# Altium schematic sheet Sheet1-BeforeClearParameters-20261026_114421_706.SchDoc
size A4; SheetNumber: 1; SheetTotal: 1
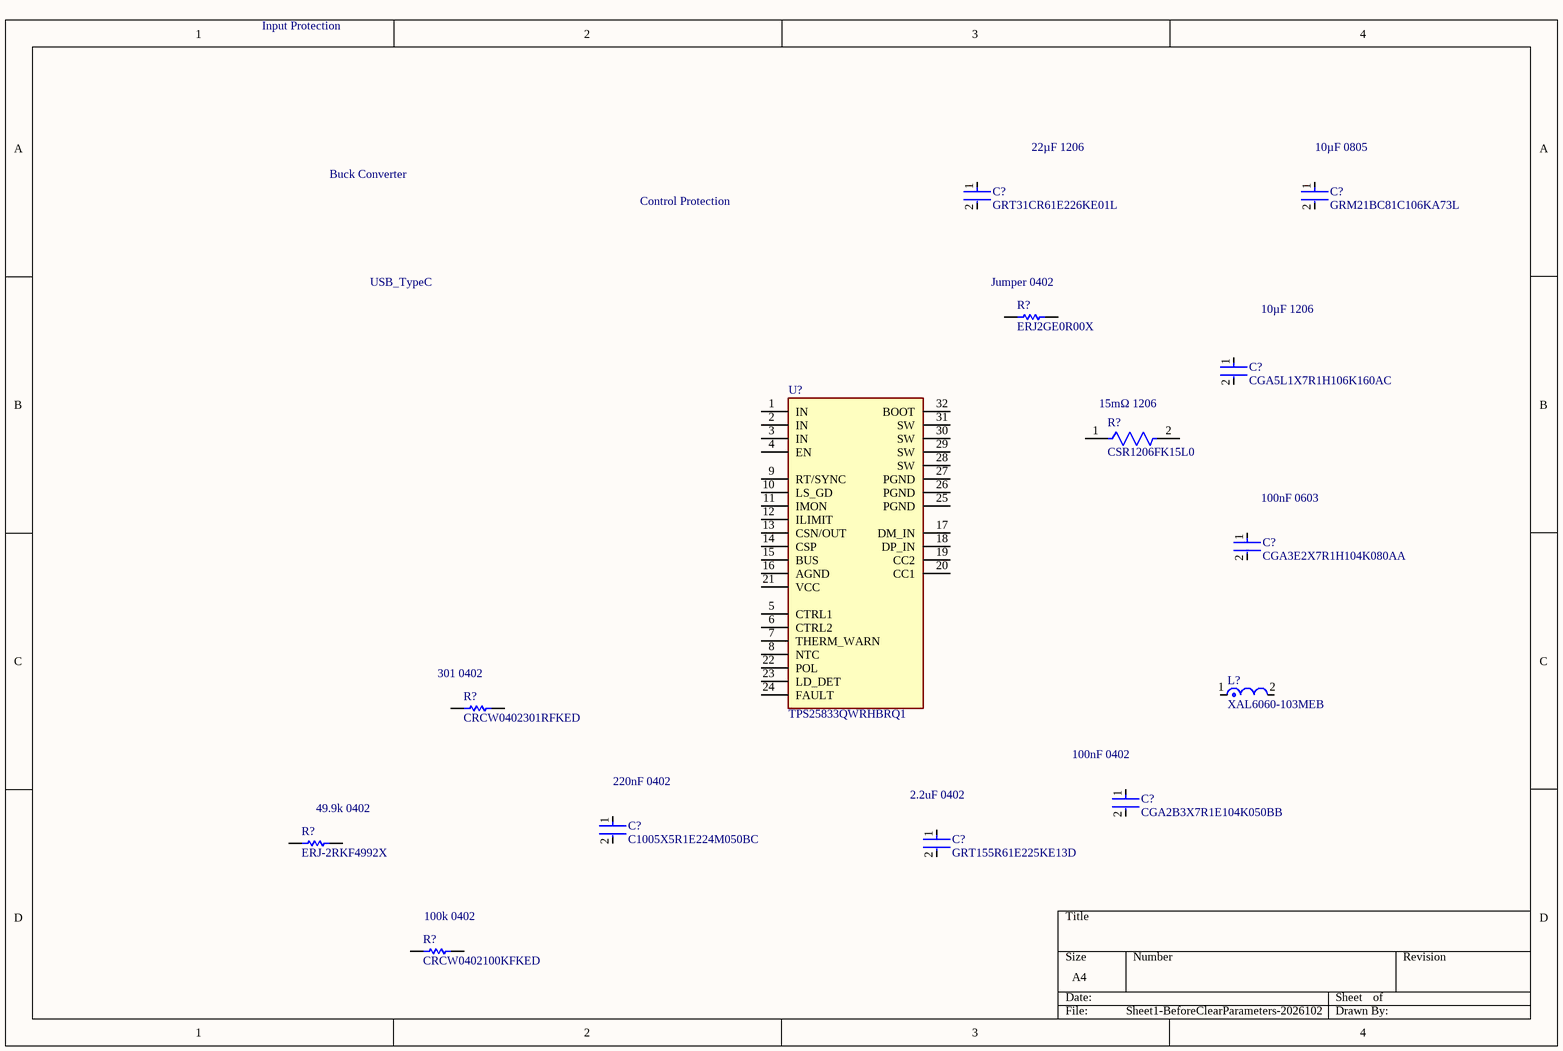
[diagram p0: Sheet1-BeforeClearParameters-20261026_114421_706.SchDoc]

## Parts
(Parts that share a designator on the sheet are numbered #1, #2 ... from top to bottom, then left to right.)
C?#1  GRT31CR61E226KE01L  [FP-CGA5L-0_3-0_1-MFG]
C?#2  GRM21BC81C106KA73L  [FP-GRM21B-0_15-MFG]
C?#3  CGA5L1X7R1H106K160AC  [FP-CGA5L-0_3-0_1-MFG]
C?#4  CGA3E2X7R1H104K080AA  [FP-CGA3E-0_3-0_1-IPC_A]
C?#5  CGA2B3X7R1E104K050BB  [FP-CGA2B-IPC_B]
C?#6  C1005X5R1E224M050BC  [FP-CGA2B-IPC_B]
C?#7  GRT155R61E225KE13D  [FP-CGA2B-IPC_B]
L?  XAL6060-103MEB  [FP-XAL6060-MFG]
R?#1  ERJ2GE0R00X  [RESC1005X40X25LL05T05]
R?#2  CSR1206FK15L0  [FP-CSR1206-IPC_B]
R?#3  CRCW0402301RFKED  [RESC1005X40X25LL05T05]
R?#4  ERJ-2RKF4992X  [RESC1005X40X25LL05T05]
R?#5  CRCW0402100KFKED  [RESC1005X40X25LL05T05]
U?  TPS25833QWRHBRQ1  [FP-RHB0032D-IPC_A]

## Nets

Not connected (* = marked no-connect by the designer): C?#1 1 2; C?#2 1 2; C?#3 1 2; C?#4 1 2; C?#5 1 2; C?#6 1 2; C?#7 1 2; L? 1 2; R?#1 1 2; R?#2 1 2; R?#3 1 2; R?#4 1 2; R?#5 1 2; U? 1(IN) 2(IN) 3(IN) 4(EN) 5(CTRL1) 6(CTRL2) 7(THERM_WARN) 8(NTC) 9(RT/SYNC) 10(LS_GD) 11(IMON) 12(ILIMIT) 13(CSN/OUT) 14(CSP) 15(BUS) 16(AGND) 17(DM_IN) 18(DP_IN) 19(CC2) 20(CC1) 21(VCC) 22(POL) 23(LD_DET) 24(FAULT) 25(PGND) 26(PGND) 27(PGND) 28(SW) 29(SW) 30(SW) 31(SW) 32(BOOT)

## Notes on the sheet
- Input Protection
- Buck Converter
- 22µF 1206
- (near C?#2) 10µF 0805
- Control Protection
- USB_TypeC
- (near R?#1) Jumper 0402
- 10µF 1206
- (near R?#2) 15mΩ 1206
- (near C?#4) 100nF 0603
- (near R?#3) 301 0402
- (near C?#6) 220nF 0402
- (near C?#7) 2.2uF 0402
- (near C?#5) 100nF 0402
- (near R?#4) 49.9k 0402
- (near R?#5) 100k 0402

## Library data of the parts
C?#1 = CMP-08246-001891-1: CAP CER 22UF 25V X5R 1206 / 22 µF ±10% 25V Ceramic Capacitor X5R 1206 (3216 Metric); Manufacturer: Murata; Manufacturer Lifecycle Status: NRND; Value: 22µF; Supplier: Arrow Electronics; Supplier Part Number: GRT31CR61E226KE01L; Manufacturer Part Number: GRT31CR61E226KE01L; RoHS: Compliant; Category: Ceramic Capacitors; Stock: 257; Pricing: 44=1.6387, 100=1.5267 (USD); Case/Package: 1206; Case Code (Imperial): 1206; Case Code (Metric): 3216; Dielectric: X5R; Dielectric Material: Ceramic; Export Control Classification Number (ECCN) Code: EAR99; Height: 1.6mm; Harmonized Tariff Schedule (HTS) Code: 8532.24.00.20; Introduction Date: 2016-01-27; Length: 3.2mm; Lifecycle Status: NRND; Max Operating Temperature: 85°C; Min Operating Temperature: -55°C; Mounting Technology: Surface Mount; Number of Terminals: 2; Packaging: Cut Tape; Ratings: AEC-Q200; REACH SVHC: Unaffected; Schedule B: 8532240020, 8532240020|8532240020|8532240020|8532240020|8532240020; Tolerance: 10%; Voltage Rating: 25V; Voltage Rating (DC): 25V; Width: 1.6mm; ComponentLink1URL: https://datasheet.octopart.com:443/GRT31CR61E226KE01L-Murata-datasheet-67697882.pdf?src-supplier=HQonline; ComponentLink1Description: https://datasheet.octopart.com:443/GRT31CR61E226KE01L-Murata-datasheet-67697882.pdf?src-supplier=HQonline; ComponentLink2URL: https://datasheet.octopart.com:443/GRT31CR61E226KE01L-Murata-datasheet-141285200.pdf?src-supplier=Geoflip; ComponentLink2Description: https://datasheet.octopart.com:443/GRT31CR61E226KE01L-Murata-datasheet-141285200.pdf?src-supplier=Geoflip; ComponentLink3URL: https://datasheet.octopart.com:443/GRT31CR61E226KE01L-Murata-datasheet-140711510.pdf?src-supplier=Ciiva; ComponentLink3Description: https://datasheet.octopart.com:443/GRT31CR61E226KE01L-Murata-datasheet-140711510.pdf?src-supplier=Ciiva; ComponentLink4URL: https://datasheet.octopart.com:443/GRT31CR61E226KE01L-Murata-datasheet-138749569.pdf?src-supplier=Ciiva; ComponentLink4Description: https://datasheet.octopart.com:443/GRT31CR61E226KE01L-Murata-datasheet-138749569.pdf?src-supplier=Ciiva; ComponentLink5URL: https://datasheet.octopart.com:443/GRT31CR61E226KE01L-Murata-datasheet-128593529.pdf?src-supplier=X-ON; ComponentLink5Description: https://datasheet.octopart.com:443/GRT31CR61E226KE01L-Murata-datasheet-128593529.pdf?src-supplier=X-ON; ComponentLink6URL: http://sigma.octopart.com:80/reach_statement/Murata-company-16.pdf?src-supplier=Compliance+Statements; ComponentLink6Description: http://sigma.octopart.com:80/reach_statement/Murata-company-16.pdf?src-supplier=Compliance+Statements
C?#2 = CMP-2007-03381-2: Chip Multilayer Ceramic Capacitors for General Purpose, 0805, 10uF, X6S, 22%, 10%, 16V; Material: Ceramic; Thickness: 0.053inch; Packaging: Tape and Reel; Width: 1.25mm; REACH SVHC: No SVHC; Depth: 1.25mm; Case Code (Metric): 2012; Capacitance: 10uF; Max Operating Temperature: 105°C; Lead Free: Lead Free; Case Code (Imperial): 0805; Min Operating Temperature: -55°C; Voltage: 16V; Radiation Hardening: No; Termination: SMD/SMT; Voltage Rating: 16V; Tolerance: 10%; Package Quantity: 1; Voltage Rating (DC): 16V; Case/Package: 0805; Dielectric: X6S; Height: 1.25mm; Mount: Surface Mount; Length: 2mm
C?#3 = CMP-08246-001891-1: Cap Ceramic 10uF 50V X7R 10% Pad SMD 1206 +125°C Automotive T/R; Voltage Rating: 50V; Capacitance: 10uF; Case/Package: 1206; Ratings: AEC-Q200; Mount: Surface Mount; Max Operating Temperature: 125°C; Min Operating Temperature: -55°C; Tolerance: 10%; Packaging: Tape and Reel; Case Code (Metric): 3216; Case Code (Imperial): 1206
C?#4 = CMP-2000-07546-2: Cap Ceramic 100nF 50V X7R 10% Pad SMD 0603 +125°C Automotive T/R; Weight: 7.1E-05oz; Composition: Ceramic; Max Operating Temperature: 125°C; Termination: SMD/SMT; Dielectric: X7R; Length: 1.6mm; Package Quantity: 1; REACH SVHC: No SVHC; Lead Free: Lead Free; Case Code (Metric): 1608; Min Operating Temperature: -55°C; Packaging: Tape and Reel; Tolerance: 10%; Voltage Rating: 50V; Case Code (Imperial): 0603; Capacitance: 100nF; Case/Package: 0603; Voltage Rating (DC): 50V; Depth: 0.8mm; Radiation Hardening: No; Ratings: AEC-Q200; Mount: Surface Mount; Voltage: 50V; Thickness: 0.035inch; Width: 0.8mm; Height: 0.8mm
C?#5 = CMP-2000-06086-2: Cap Ceramic 100nF 25V X7R 10% Pad SMD 0402 +125°C Automotive T/R; Lead Free: Lead Free; Termination: SMD/SMT; Voltage Rating: 25V; Voltage: 25V; Composition: Ceramic; Case/Package: 0402; Mount: Surface Mount; Voltage Rating (DC): 25V; Tolerance: 10%; Length: 1mm; Width: 0.02inch; REACH SVHC: No SVHC; Max Operating Temperature: 125°C; Case Code (Metric): 1005; Case Code (Imperial): 0402; Package Quantity: 1; Depth: 0.5mm; Min Operating Temperature: -55°C; Thickness: 0.022inch; Capacitance: 100nF; Height: 0.5mm; Dielectric: X7R; Packaging: Tape and Reel; Weight: 2.3E-05oz; Ratings: AEC-Q200
C?#6 = CMP-2000-06086-2: 25V 220nF X5R 卤20% 0402 Multilayer Ceramic Capacitors MLCC - SMD/SMT ROHS; Manufacturer: TDK; Manufacturer Lifecycle Status: PRODUCTION (NOT RECOMMENDED FOR NEW DESIGN); Tolerance: 20%; Supplier: Avnet; Supplier Part Number: C1005X5R1E224M050BC; Manufacturer Part Number: C1005X5R1E224M050BC; RoHS: Compliant; Category: Ceramic Capacitors; Pricing: 10000=0.0212 (USD); Value: 220nF; Case/Package: 0402; Case Code (Imperial): 0402; Case Code (Metric): 1005; China RoHS: Compliant; Composition: Ceramic; Depth: 500µm; Dielectric: X5R; Dielectric Material: Ceramic; Export Control Classification Number (ECCN) Code: EAR99; Height: 500µm; Harmonized Tariff Schedule (HTS) Code: 8532.24.00.20; Introduction Date: 2012-08-21; Lead Free: Lead Free; Length: 1mm; Lifecycle Status: NRND; Material: Ceramic; Max Length: 1.05mm; Max Operating Temperature: 85°C; Max Width: 550µm; Min Length: 950µm; Min Operating Temperature: -55°C; Min Width: 450µm; Mounting Technology: Surface Mount; Number of Terminals: 2; REACH SVHC: Unaffected; Termination: SMD/SMT; Voltage Rating: 25V; Voltage Rating (DC): 25V; Weight: 652.039032µg; Width: 500µm; ComponentLink1URL: https://datasheet.octopart.com:443/C1005X5R1E224M050BC-TDK-datasheet-175423548.pdf?src-supplier=IHS; ComponentLink1Description: https://datasheet.octopart.com:443/C1005X5R1E224M050BC-TDK-datasheet-175423548.pdf?src-supplier=IHS; ComponentLink2URL: https://datasheet.octopart.com:443/C1005X5R1E224M050BC-TDK-datasheet-151546523.pdf?src-supplier=TDK; ComponentLink2Description: https://datasheet.octopart.com:443/C1005X5R1E224M050BC-TDK-datasheet-151546523.pdf?src-supplier=TDK; ComponentLink3URL: https://datasheet.octopart.com/C1005X5R1E224M050BC-TDK-datasheet-41194876.pdf; ComponentLink3Description: https://datasheet.octopart.com/C1005X5R1E224M050BC-TDK-datasheet-41194876.pdf; ComponentLink4URL: https://datasheet.octopart.com/C-Series-Ceramic-Chip-Capacitors-TDK-datasheet-family-84.pdf; ComponentLink4Description: https://datasheet.octopart.com/C-Series-Ceramic-Chip-Capacitors-TDK-datasheet-family-84.pdf; ComponentLink5URL: https://datasheet.octopart.com:443/C1005X5R1E224M050BC-TDK-datasheet-82475248.pdf?src-supplier=Newark; ComponentLink5Description: https://datasheet.octopart.com:443/C1005X5R1E224M050BC-TDK-datasheet-82475248.pdf?src-supplier=Newark; ComponentLink6URL: https://datasheet.octopart.com:443/C1005X5R1E224M050BC-TDK-datasheet-13444418.pdf?src-supplier=Future+Electronics; ComponentLink6Description: https://datasheet.octopart.com:443/C1005X5R1E224M050BC-TDK-datasheet-13444418.pdf?src-supplier=Future+Electronics; ComponentLink7URL: https://datasheet.octopart.com:443/C1005X5R1E224M050BC-TDK-datasheet-17817446.pdf?src-supplier=Future+Electronics; ComponentLink7Description: https://datasheet.octopart.com:443/C1005X5R1E224M050BC-TDK-datasheet-17817446.pdf?src-supplier=Future+Electronics; ComponentLink8URL: https://datasheet.octopart.com:443/C1005X5R1E224M050BC-TDK-datasheet-10921857.pdf?src-supplier=Electro+Sonic; ComponentLink8Description: https://datasheet.octopart.com:443/C1005X5R1E224M050BC-TDK-datasheet-10921857.pdf?src-supplier=Electro+Sonic; ComponentLink9URL: http://sigma.octopart.com:80/rohs_certificate/C-Series-Ceramic-Chip-Capacitors-TDK-family-108.pdf?src-supplier=Compliance+Statements; ComponentLink9Description: http://sigma.octopart.com:80/rohs_certificate/C-Series-Ceramic-Chip-Capacitors-TDK-family-108.pdf?src-supplier=Compliance+Statements
C?#7 = CMP-2000-06086-2: 25V 2.2uF X5R ±10% 0402 Multilayer Ceramic Capacitors MLCC - SMD/SMT ROHS; Manufacturer: Murata; Manufacturer Lifecycle Status: IN PRODUCTION; Value: 2.2µF; Supplier: Future Electronics; Supplier Part Number: GRT155R61E225KE13D; Manufacturer Part Number: GRT155R61E225KE13D; RoHS: Compliant; Category: Ceramic Capacitors; Stock: 170000; Pricing: 10000=0.168 (USD); Case/Package: 0402; Case Code (Imperial): 0402; Case Code (Metric): 1005; Dielectric: X5R; Dielectric Material: Ceramic; Export Control Classification Number (ECCN) Code: EAR99; Height: 500µm; Harmonized Tariff Schedule (HTS) Code: 8532.24.00.20; Introduction Date: 2016-01-27; Length: 1mm; Lifecycle Status: Production; Material: Ceramic; Max Operating Temperature: 85°C; Min Operating Temperature: -55°C; Mounting Technology: Surface Mount; Number of Terminals: 2; Packaging: Cut Tape; Ratings: AEC-Q200; REACH SVHC: Unaffected; Schedule B: 8532240020, 8532240020|8532240020, 8532240020|8532240020|8532240020, 8532240020|8532240020|8532240020|8532240020; Tolerance: 10%; Voltage Rating: 25V; Voltage Rating (DC): 25V; Width: 500µm; ComponentLink1URL: https://datasheet.octopart.com:443/GRT155R61E225KE13D-Murata-datasheet-149523572.pdf?src-supplier=Farnell; ComponentLink1Description: https://datasheet.octopart.com:443/GRT155R61E225KE13D-Murata-datasheet-149523572.pdf?src-supplier=Farnell; ComponentLink2URL: https://datasheet.octopart.com:443/GRT155R61E225KE13D-Murata-datasheet-67697706.pdf?src-supplier=Newark; ComponentLink2Description: https://datasheet.octopart.com:443/GRT155R61E225KE13D-Murata-datasheet-67697706.pdf?src-supplier=Newark; ComponentLink3URL: https://datasheet.octopart.com:443/GRT155R61E225KE13D-Murata-datasheet-141283924.pdf?src-supplier=Geoflip; ComponentLink3Description: https://datasheet.octopart.com:443/GRT155R61E225KE13D-Murata-datasheet-141283924.pdf?src-supplier=Geoflip; ComponentLink4URL: https://datasheet.octopart.com:443/GRT155R61E225KE13D-Murata-datasheet-178522875.pdf?src-supplier=Arrow.cn; ComponentLink4Description: https://datasheet.octopart.com:443/GRT155R61E225KE13D-Murata-datasheet-178522875.pdf?src-supplier=Arrow.cn; ComponentLink5URL: https://datasheet.octopart.com:443/GRT155R61E225KE13D-Murata-datasheet-165579666.pdf?src-supplier=TME; ComponentLink5Description: https://datasheet.octopart.com:443/GRT155R61E225KE13D-Murata-datasheet-165579666.pdf?src-supplier=TME; ComponentLink6URL: https://datasheet.octopart.com:443/GRT155R61E225KE13D-Murata-datasheet-140711002.pdf?src-supplier=Ciiva; ComponentLink6Description: https://datasheet.octopart.com:443/GRT155R61E225KE13D-Murata-datasheet-140711002.pdf?src-supplier=Ciiva; ComponentLink7URL: https://datasheet.octopart.com:443/GRT155R61E225KE13D-Murata-datasheet-138748731.pdf?src-supplier=Ciiva; ComponentLink7Description: https://datasheet.octopart.com:443/GRT155R61E225KE13D-Murata-datasheet-138748731.pdf?src-supplier=Ciiva; ComponentLink8URL: https://datasheet.octopart.com:443/GRT155R61E225KE13D-Murata-datasheet-82944872.pdf?src-supplier=Future+Electronics; ComponentLink8Description: https://datasheet.octopart.com:443/GRT155R61E225KE13D-Murata-datasheet-82944872.pdf?src-supplier=Future+Electronics; ComponentLink9URL: http://sigma.octopart.com:80/reach_statement/Murata-company-16.pdf?src-supplier=Compliance+Statements; ComponentLink9Description: http://sigma.octopart.com:80/reach_statement/Murata-company-16.pdf?src-supplier=Compliance+Statements
L? = CMP-11268-000112-1: Power inductor, shielded,10uH 20% tol, 29.82mOhms, SMT, RoHS, Halogen Free, AEC - Q200; Self Resonant Frequency: 14MHz; Core Material: Composite; Max DC Current: 7A; Test Frequency: 100kHz; DC Resistance (DCR): 29.82mR; Package Quantity: 21; Length: 6.76mm; RoHS Compliant: Yes; Min Operating Temperature: -40°C; Tolerance: 20%; Max Operating Temperature: 125°C; Series: XAL6060; Termination: SMD/SMT; Shielding: Shielded; Height: 6.1mm; Lead Free: Contains Lead; Width: 6.56mm; Packaging: Tape and Reel; Inductance: 10uH
R?#1 = CMP-2000-07451-1: Chip Resistor, 0 Ohm, 0.1 W, -55 to 155 degC, 0402 (1005 Metric), RoHS, Tape and Reel; Manufacturer: Panasonic; Voltage Rating (DC): 50V; Temperature Coefficient: 600ppm/��C; Max Power Dissipation: 100mW; Resistance: 0mOhm; Tolerance: 5%; Number of Terminations: 2; Mount: SurfaceMount; Height: 0.35mm; Packaging: TapeandReel; Contact Plating: Tin; Manufacturer URL: http://www.panasonic.com/; Composition: ThickFilm; Max Operating Temperature: 155degC; REACH SVHC: NoSVHC; Case/Package: 0402; Package Reference: 402; Depth: 0.5mm; Package Description: 2-Pin Surface Mount Device, Body 1 x 0.5 mm; Datasheet URL: https://industrial.panasonic.com/cdbs/www-data/pdf/RDA0000/AOA0000C301.pdf; RoHSCompliant: True; Case Code (Imperial): 0402; Military Standard: Not; Min Operating Temperature: -55degC; Power Rating: 100mW; Datasheet Version: 03/2015; Length: 1mm; Case Code (Metric): 1005; Termination: SMD/SMT; Mounting Technology: SurfaceMount; Voltage Rating: 50V; Width: 0.02inch; Package Quantity: 1; Lead Free: LeadFree; Radiation Hardening: No
R?#2 = CMP-26527-006578-1: General Purpose Thick Film Chip Resistor, 1206, 15mΩ, 1%, 0.5W; Temperature Coefficient: 100ppm/°C; Max Power Dissipation: 500mW; Resistance: 15mR; Length: 0.12inch; Mount: Surface Mount; Resistor Type: Thick Film; Number of Terminations: 2; Contact Plating: Tin; Max Operating Temperature: 155°C; Height: 0.026inch; Radiation Hardening: No; Case Code (Imperial): 1206; Width: 0.061inch; Tolerance: 1%; Series: CSR; RoHS Compliant: Yes; Case/Package: 1206; Min Operating Temperature: -55°C; Case Code (Metric): 3216; Packaging: Tape and Reel; Lead Free: Lead Free
R?#3 = CMP-2000-07451-1: Manufacturer: Vishay; Description: Fixed Resistor, Metal Glaze/Thick Film, 0.063W, 301ohm, 50V, 1% +/-Tol, Surface Mount, 0402; Max Power Dissipation: 63mW; Value: 301Ω; Temperature Coefficient: 100ppm/°C; Tolerance: 1%; Voltage Rating: 50V; Supplier: Future Electronics; Supplier Part Number: CRCW0402301RFKED; Manufacturer Part Number: CRCW0402301RFKED; RoHS: Compliant; Category: Chip SMD Resistors; Stock: 190000; Pricing: 10000=0.0043, 40000=0.0042, 150000=0.004, 250000=0.0039, 500000=0.0038 (USD); Case/Package: 0402; Case Code (Imperial): 0402; China RoHS: Non-Compliant; Composition: Thick Film; Contact Plating: Tin; Depth: 500µm; Features: Automotive AEC-Q200; Height: 350µm; Lead Free: Lead Free; Length: 1mm; Lifecycle Status: Production; Max Operating Temperature: 155°C; Military Standard: Not; Min Operating Temperature: -55°C; Mounting Technology: Surface Mount; Pins: 2; Number of Terminals: 2; Number of Terminations: 2; Packaging: Cut Tape; Power Rating: 63mW; Radiation Hardening: No; Ratings: AEC-Q200; REACH SVHC: Unaffected; Schedule B: 8533210045, 8533210045|8533210045|8533210045|8533210045|8533210045|8533210045|8533210045|8533210045|8533210045|8533210045|8533210045|8533210045|8533210045|8533210045|8533210045|8533210045|8533210045|8533210045|8533210045|8533210045|8533210045|8533210045|8533210045|85; Termination: SMD/SMT; Voltage Rating (DC): 50V; Weight: 652.039032µg; Width: 500µm; Working Voltage: 50V; ComponentLink1URL: https://datasheet.octopart.com:443/CRCW0402301RFKED-Vishay-datasheet-175423584.pdf?src-supplier=IHS; ComponentLink1Description: https://datasheet.octopart.com:443/CRCW0402301RFKED-Vishay-datasheet-175423584.pdf?src-supplier=IHS; ComponentLink2URL: https://datasheet.octopart.com:443/CRCW0402301RFKED-Vishay-datasheet-83961561.pdf?src-supplier=element14+APAC; ComponentLink2Description: https://datasheet.octopart.com:443/CRCW0402301RFKED-Vishay-datasheet-83961561.pdf?src-supplier=element14+APAC; ComponentLink3URL: https://datasheet.octopart.com:443/CRCW0402301RFKED-Vishay-datasheet-10882403.pdf?src-supplier=element14+APAC; ComponentLink3Description: https://datasheet.octopart.com:443/CRCW0402301RFKED-Vishay-datasheet-10882403.pdf?src-supplier=element14+APAC; ComponentLink4URL: https://datasheet.octopart.com:443/CRCW0402301RFKED-Vishay-datasheet-159614168.pdf?src-supplier=element14+APAC; ComponentLink4Description: https://datasheet.octopart.com:443/CRCW0402301RFKED-Vishay-datasheet-159614168.pdf?src-supplier=element14+APAC; ComponentLink5URL: https://datasheet.octopart.com:443/CRCW0402301RFKED-Vishay-datasheet-66077789.pdf?src-supplier=Newark; ComponentLink5Description: https://datasheet.octopart.com:443/CRCW0402301RFKED-Vishay-datasheet-66077789.pdf?src-supplier=Newark; ComponentLink6URL: https://datasheet.octopart.com:443/CRCW0402301RFKED-Vishay-datasheet-11516975.pdf?src-supplier=Newark; ComponentLink6Description: https://datasheet.octopart.com:443/CRCW0402301RFKED-Vishay-datasheet-11516975.pdf?src-supplier=Newark; ComponentLink7URL: https://datasheet.octopart.com:443/CRCW0402301RFKED-Vishay-datasheet-41302739.pdf?src-supplier=Newark; ComponentLink7Description: https://datasheet.octopart.com:443/CRCW0402301RFKED-Vishay-datasheet-41302739.pdf?src-supplier=Newark; ComponentLink8URL: https://datasheet.octopart.com:443/CRCW0402301RFKED-Vishay-datasheet-33013972.pdf?src-supplier=Newark; ComponentLink8Description: https://datasheet.octopart.com:443/CRCW0402301RFKED-Vishay-datasheet-33013972.pdf?src-supplier=Newark; ComponentLink9URL: https://datasheet.octopart.com:443/CRCW0402301RFKED-Vishay-datasheet-21226360.pdf?src-supplier=Newark; ComponentLink9Description: https://datasheet.octopart.com:443/CRCW0402301RFKED-Vishay-datasheet-21226360.pdf?src-supplier=Newark; ComponentLink10URL: https://datasheet.octopart.com:443/CRCW0402301RFKED-Vishay-datasheet-62317933.pdf?src-supplier=Farnell; ComponentLink10Description: https://datasheet.octopart.com:443/CRCW0402301RFKED-Vishay-datasheet-62317933.pdf?src-supplier=Farnell; ComponentLink11URL: https://datasheet.octopart.com:443/CRCW0402301RFKED-Vishay-datasheet-14722531.pdf?src-supplier=Farnell; ComponentLink11Description: https://datasheet.octopart.com:443/CRCW0402301RFKED-Vishay-datasheet-14722531.pdf?src-supplier=Farnell; ComponentLink12URL: https://datasheet.octopart.com:443/CRCW0402301RFKED-Vishay-datasheet-5300368.pdf?src-supplier=Farnell; ComponentLink12Description: https://datasheet.octopart.com:443/CRCW0402301RFKED-Vishay-datasheet-5300368.pdf?src-supplier=Farnell; ComponentLink13URL: https://datasheet.octopart.com:443/CRCW0402301RFKED-Vishay-datasheet-190005712.pdf?src-supplier=TME; ComponentLink13Description: https://datasheet.octopart.com:443/CRCW0402301RFKED-Vishay-datasheet-190005712.pdf?src-supplier=TME; ComponentLink14URL: https://datasheet.octopart.com:443/CRCW0402301RFKED-Vishay-datasheet-62316122.pdf?src-supplier=Future+Electronics; ComponentLink14Description: https://datasheet.octopart.com:443/CRCW0402301RFKED-Vishay-datasheet-62316122.pdf?src-supplier=Future+Electronics; ComponentLink15URL: https://datasheet.octopart.com:443/CRCW0402301RFKED-Vishay-datasheet-13544682.pdf?src-supplier=Future+Electronics; ComponentLink15Description: https://datasheet.octopart.com:443/CRCW0402301RFKED-Vishay-datasheet-13544682.pdf?src-supplier=Future+Electronics; ComponentLink16URL: https://datasheet.octopart.com:443/CRCW0402301RFKED-Vishay-datasheet-12542115.pdf?src-supplier=Future+Electronics; ComponentLink16Description: https://datasheet.octopart.com:443/CRCW0402301RFKED-Vishay-datasheet-12542115.pdf?src-supplier=Future+Electronics; ComponentLink17URL: https://datasheet.octopart.com:443/CRCW0402301RFKED-Vishay-datasheet-12533120.pdf?src-supplier=Future+Electronics; ComponentLink17Description: https://datasheet.octopart.com:443/CRCW0402301RFKED-Vishay-datasheet-12533120.pdf?src-supplier=Future+Electronics; ComponentLink18URL: https://datasheet.octopart.com:443/CRCW0402301RFKED-Vishay-datasheet-12520421.pdf?src-supplier=Future+Electronics; ComponentLink18Description: https://datasheet.octopart.com:443/CRCW0402301RFKED-Vishay-datasheet-12520421.pdf?src-supplier=Future+Electronics; ComponentLink19URL: https://datasheet.octopart.com:443/CRCW0402301RFKED-Vishay-datasheet-12511221.pdf?src-supplier=Future+Electronics; ComponentLink19Description: https://datasheet.octopart.com:443/CRCW0402301RFKED-Vishay-datasheet-12511221.pdf?src-supplier=Future+Electronics; ComponentLink20URL: https://datasheet.octopart.com:443/CRCW0402301RFKED-Vishay-Dale-datasheet-47688880.pdf?src-supplier=RS+(Formerly+Allied+Electronics); ComponentLink20Description: https://datasheet.octopart.com:443/CRCW0402301RFKED-Vishay-Dale-datasheet-47688880.pdf?src-supplier=RS+(Formerly+Allied+Electronics); ComponentLink21URL: https://datasheet.octopart.com:443/CRCW0402301RFKED-Vishay-datasheet-12001583.pdf?src-supplier=RS+(Formerly+Allied+Electronics); ComponentLink21Description: https://datasheet.octopart.com:443/CRCW0402301RFKED-Vishay-datasheet-12001583.pdf?src-supplier=RS+(Formerly+Allied+Electronics); ComponentLink22URL: https://datasheet.octopart.com:443/CRCW0402301RFKED-Vishay-datasheet-5306405.pdf?src-supplier=RS+(Formerly+Allied+Electronics); ComponentLink22Description: https://datasheet.octopart.com:443/CRCW0402301RFKED-Vishay-datasheet-5306405.pdf?src-supplier=RS+(Formerly+Allied+Electronics); ComponentLink23URL: https://datasheet.octopart.com:443/CRCW0402301RFKED-Vishay-datasheet-11540273.pdf?src-supplier=Arrow+Electronics; ComponentLink23Description: https://datasheet.octopart.com:443/CRCW0402301RFKED-Vishay-datasheet-11540273.pdf?src-supplier=Arrow+Electronics; ComponentLink24URL: https://datasheet.octopart.com:443/CRCW0402301RFKED-Vishay-datasheet-8445837.pdf?src-supplier=element14; ComponentLink24Description: https://datasheet.octopart.com:443/CRCW0402301RFKED-Vishay-datasheet-8445837.pdf?src-supplier=element14; ComponentLink25URL: https://datasheet.octopart.com:443/CRCW0402301RFKED-Vishay-datasheet-5377255.pdf?src-supplier=Garrett; ComponentLink25Description: https://datasheet.octopart.com:443/CRCW0402301RFKED-Vishay-datasheet-5377255.pdf?src-supplier=Garrett; ComponentLink26URL: https://datasheet.octopart.com:443/CRCW0402301RFKED-Vishay-datasheet-148188.pdf?src-supplier=Garrett; ComponentLink26Description: https://datasheet.octopart.com:443/CRCW0402301RFKED-Vishay-datasheet-148188.pdf?src-supplier=Garrett; ComponentLink27URL: https://datasheet.octopart.com:443/CRCW0402301RFKED-Vishay-datasheet-42367.pdf?src-supplier=Garrett; ComponentLink27Description: https://datasheet.octopart.com:443/CRCW0402301RFKED-Vishay-datasheet-42367.pdf?src-supplier=Garrett; ComponentLink28URL: http://sigma.octopart.com:80/rohs_statement/Vishay-company-15.pdf?src-supplier=Compliance+Statements; ComponentLink28Description: http://sigma.octopart.com:80/rohs_statement/Vishay-company-15.pdf?src-supplier=Compliance+Statements
R?#4 = CMP-2000-07451-1: Manufacturer: Panasonic; Manufacturer Part Number: ERJ2RKF4992X; Manufacturer Lifecycle Status: ACTIVE; Part Series: Precision Thick Film Chip Resistors; Description: Res Thick Film 0402 49.9K Ohm 1% 0.1W(1/10W) ±100ppm/C Pad SMD Automotive T/R; Max Power Dissipation: 100mW; Value: 49.9kΩ; Temperature Coefficient: 100ppm/°C; Tolerance: 1%; Voltage Rating: 50V; Supplier: Future Electronics; Supplier Part Number: ERJ-2RKF4992X; RoHS: Compliant; Category: Chip SMD Resistors; Stock: 150000; Pricing: 10000=0.0105, 30000=0.0102, 50000=0.0099, 150000=0.0097, 250000=0.0094 (USD); Case/Package: 0402; Case Code (Imperial): 0402; China RoHS: Non-Compliant; Composition: Thick Film; Contact Plating: Tin; Country of Origin: Japan, Mainland China; Depth: 500µm; Export Control Classification Number (ECCN) Code: EAR99; Features: Automotive AEC-Q200; Height: 350µm; Harmonized Tariff Schedule (HTS) Code: 8533.21.00.30; Introduction Date: 2004-02-02; Lead Free: Lead Free; Length: 1mm; Lifecycle Status: Production; Max Operating Temperature: 155°C; Military Standard: Not; Min Operating Temperature: -55°C; Mounting Technology: Surface Mount; Number of Terminals: 2; Number of Terminations: 2; Packaging: Cut Tape; Power Rating: 100mW; Radiation Hardening: No; Ratings: AEC-Q200; REACH SVHC: Unaffected; Schedule B: 8533210045, 8533210045|8533210045|8533210045|8533210045|8533210045; Termination: SMD/SMT; Voltage Rating (DC): 50V; Width: 500µm; Working Voltage: 50V; ComponentLink1URL: https://datasheet.octopart.com:443/ERJ2RKF4992X-Panasonic-datasheet-82288794.pdf?src-supplier=Upverter; ComponentLink1Description: https://datasheet.octopart.com:443/ERJ2RKF4992X-Panasonic-datasheet-82288794.pdf?src-supplier=Upverter; ComponentLink2URL: https://datasheet.octopart.com:443/ERJ2RKF4992X-Panasonic-datasheet-13266541.pdf?src-supplier=RS+(Formerly+Allied+Electronics); ComponentLink2Description: https://datasheet.octopart.com:443/ERJ2RKF4992X-Panasonic-datasheet-13266541.pdf?src-supplier=RS+(Formerly+Allied+Electronics); ComponentLink3URL: https://datasheet.octopart.com:443/ERJ2RKF4992X-Panasonic-datasheet-10025800.pdf?src-supplier=Future+Electronics; ComponentLink3Description: https://datasheet.octopart.com:443/ERJ2RKF4992X-Panasonic-datasheet-10025800.pdf?src-supplier=Future+Electronics; ComponentLink4URL: https://datasheet.octopart.com:443/ERJ2RKF4992X-Panasonic-datasheet-8853621.pdf?src-supplier=Future+Electronics; ComponentLink4Description: https://datasheet.octopart.com:443/ERJ2RKF4992X-Panasonic-datasheet-8853621.pdf?src-supplier=Future+Electronics; ComponentLink5URL: https://datasheet.octopart.com:443/ERJ2RKF4992X-Panasonic-datasheet-5313456.pdf?src-supplier=Future+Electronics; ComponentLink5Description: https://datasheet.octopart.com:443/ERJ2RKF4992X-Panasonic-datasheet-5313456.pdf?src-supplier=Future+Electronics; ComponentLink6URL: https://datasheet.octopart.com:443/ERJ2RKF4992X-Panasonic-datasheet-48891056.pdf?src-supplier=Newark; ComponentLink6Description: https://datasheet.octopart.com:443/ERJ2RKF4992X-Panasonic-datasheet-48891056.pdf?src-supplier=Newark; ComponentLink7URL: https://datasheet.octopart.com:443/ERJ2RKF4992X-Panasonic-datasheet-136608610.pdf?src-supplier=Newark; ComponentLink7Description: https://datasheet.octopart.com:443/ERJ2RKF4992X-Panasonic-datasheet-136608610.pdf?src-supplier=Newark; ComponentLink8URL: https://datasheet.octopart.com:443/ERJ-2RKF4992X-Panasonic-datasheet-154766169.pdf?src-supplier=JRH+Electronics; ComponentLink8Description: https://datasheet.octopart.com:443/ERJ-2RKF4992X-Panasonic-datasheet-154766169.pdf?src-supplier=JRH+Electronics; ComponentLink9URL: https://datasheet.octopart.com:443/ERJ2RKF4992X-Panasonic-datasheet-164353789.pdf?src-supplier=HQonline; ComponentLink9Description: https://datasheet.octopart.com:443/ERJ2RKF4992X-Panasonic-datasheet-164353789.pdf?src-supplier=HQonline; ComponentLink10URL: https://datasheet.octopart.com:443/ERJ2RKF4992X-Panasonic-datasheet-188592431.pdf?src-supplier=TME; ComponentLink10Description: https://datasheet.octopart.com:443/ERJ2RKF4992X-Panasonic-datasheet-188592431.pdf?src-supplier=TME; ComponentLink11URL: https://datasheet.octopart.com/ERJ2RKF4992X-Panasonic-datasheet-78375410.pdf; ComponentLink11Description: https://datasheet.octopart.com/ERJ2RKF4992X-Panasonic-datasheet-78375410.pdf; ComponentLink12URL: https://datasheet.octopart.com:443/ERJ-2RKF4992X-Panasonic---ECG-datasheet-15994758.pdf?src-supplier=Farnell; ComponentLink12Description: https://datasheet.octopart.com:443/ERJ-2RKF4992X-Panasonic---ECG-datasheet-15994758.pdf?src-supplier=Farnell; ComponentLink13URL: https://datasheet.octopart.com:443/ERJ2RKF4992X-Panasonic-datasheet-7538305.pdf?src-supplier=Jameco+(USA); ComponentLink13Description: https://datasheet.octopart.com:443/ERJ2RKF4992X-Panasonic-datasheet-7538305.pdf?src-supplier=Jameco+(USA); ComponentLink14URL: https://datasheet.octopart.com:443/ERJ-2RKF4992X-Panasonic-datasheet-118621.pdf?src-supplier=DigiKey; ComponentLink14Description: https://datasheet.octopart.com:443/ERJ-2RKF4992X-Panasonic-datasheet-118621.pdf?src-supplier=DigiKey; ComponentLink15URL: https://datasheet.octopart.com:443/ERJ-2RKF4992X-Panasonic-datasheet-41391857.pdf?src-supplier=Electro+Sonic; ComponentLink15Description: https://datasheet.octopart.com:443/ERJ-2RKF4992X-Panasonic-datasheet-41391857.pdf?src-supplier=Electro+Sonic
R?#5 = CMP-2000-07451-1: Manufacturer: Vishay; Description: 63mW Thick Film Resistors 75V ±1% ±100ppm/℃ 100kΩ 0402 Chip Resistor - Surface Mount ROHS; Max Power Dissipation: 63mW; Value: 100kΩ; Temperature Coefficient: 100ppm/°C; Tolerance: 1%; Voltage Rating: 50V; Supplier: Future Electronics; Supplier Part Number: CRCW0402100KFKED; Manufacturer Part Number: CRCW0402100KFKED; RoHS: Compliant; Category: Chip SMD Resistors; Stock: 19070000; Pricing: 20000=0.0014, 50000=0.0014, 250000=0.0013, 500000=0.0013, 1500000=0.0013 (USD); Case/Package: 0402; Case Code (Imperial): 0402; China RoHS: Non-Compliant; Composition: Thick Film; Contact Plating: Tin; Depth: 500µm; Features: Automotive AEC-Q200; Height: 350µm; Lead Free: Lead Free; Length: 1mm; Lifecycle Status: Production; Max Operating Temperature: 155°C; Military Standard: Not; Min Operating Temperature: -55°C; Mounting Technology: Surface Mount; Pins: 2; Number of Terminals: 2; Number of Terminations: 2; Packaging: Cut Tape; Power Rating: 63mW; Radiation Hardening: No; Ratings: AEC-Q200; REACH SVHC: Unaffected; Schedule B: 8533210045, 8533210045|8533210045|8533210045|8533210045|8533210045|8533210045|8533210045|8533210045|8533210045|8533210045|8533210045|8533210045|8533210045|8533210045|8533210045|8533210045|8533210045|8533210045|8533210045|8533210045|8533210045|8533210045|8533210045|85; Termination: SMD/SMT; Voltage Rating (DC): 50V; Weight: 652.039032µg; Width: 500µm; Working Voltage: 50V; ComponentLink1URL: https://datasheet.octopart.com:443/CRCW0402100KFKED-Vishay-datasheet-175423584.pdf?src-supplier=IHS; ComponentLink1Description: https://datasheet.octopart.com:443/CRCW0402100KFKED-Vishay-datasheet-175423584.pdf?src-supplier=IHS; ComponentLink2URL: https://datasheet.octopart.com:443/CRCW0402100KFKED-Vishay-datasheet-21268119.pdf?src-supplier=Upverter; ComponentLink2Description: https://datasheet.octopart.com:443/CRCW0402100KFKED-Vishay-datasheet-21268119.pdf?src-supplier=Upverter; ComponentLink3URL: https://datasheet.octopart.com:443/CRCW0402100KFKED-Vishay-datasheet-83961561.pdf?src-supplier=element14+APAC; ComponentLink3Description: https://datasheet.octopart.com:443/CRCW0402100KFKED-Vishay-datasheet-83961561.pdf?src-supplier=element14+APAC; ComponentLink4URL: https://datasheet.octopart.com:443/CRCW0402100KFKED-Vishay-datasheet-62317933.pdf?src-supplier=element14+APAC; ComponentLink4Description: https://datasheet.octopart.com:443/CRCW0402100KFKED-Vishay-datasheet-62317933.pdf?src-supplier=element14+APAC; ComponentLink5URL: https://datasheet.octopart.com:443/CRCW0402100KFKED-Vishay-datasheet-14722531.pdf?src-supplier=element14+APAC; ComponentLink5Description: https://datasheet.octopart.com:443/CRCW0402100KFKED-Vishay-datasheet-14722531.pdf?src-supplier=element14+APAC; ComponentLink6URL: https://datasheet.octopart.com:443/CRCW0402100KFKED-Vishay-datasheet-66077789.pdf?src-supplier=element14+APAC; ComponentLink6Description: https://datasheet.octopart.com:443/CRCW0402100KFKED-Vishay-datasheet-66077789.pdf?src-supplier=element14+APAC; ComponentLink7URL: https://datasheet.octopart.com:443/CRCW0402100KFKED-Vishay-datasheet-16179825.pdf?src-supplier=element14+APAC; ComponentLink7Description: https://datasheet.octopart.com:443/CRCW0402100KFKED-Vishay-datasheet-16179825.pdf?src-supplier=element14+APAC; ComponentLink8URL: https://datasheet.octopart.com:443/CRCW0402100KFKED.-Vishay-datasheet-78776209.pdf?src-supplier=Newark; ComponentLink8Description: https://datasheet.octopart.com:443/CRCW0402100KFKED.-Vishay-datasheet-78776209.pdf?src-supplier=Newark; ComponentLink9URL: https://datasheet.octopart.com:443/CRCW0402100KFKED-Vishay-datasheet-11516975.pdf?src-supplier=Newark; ComponentLink9Description: https://datasheet.octopart.com:443/CRCW0402100KFKED-Vishay-datasheet-11516975.pdf?src-supplier=Newark; ComponentLink10URL: https://datasheet.octopart.com:443/CRCW0402100KFKED-Vishay-datasheet-41302739.pdf?src-supplier=Newark; ComponentLink10Description: https://datasheet.octopart.com:443/CRCW0402100KFKED-Vishay-datasheet-41302739.pdf?src-supplier=Newark; ComponentLink11URL: https://datasheet.octopart.com:443/CRCW0402100KFKED-Vishay-datasheet-27121962.pdf?src-supplier=Newark; ComponentLink11Description: https://datasheet.octopart.com:443/CRCW0402100KFKED-Vishay-datasheet-27121962.pdf?src-supplier=Newark; ComponentLink12URL: https://datasheet.octopart.com:443/CRCW0402100KFKED-Vishay-datasheet-5300368.pdf?src-supplier=Future+Electronics; ComponentLink12Description: https://datasheet.octopart.com:443/CRCW0402100KFKED-Vishay-datasheet-5300368.pdf?src-supplier=Future+Electronics; ComponentLink13URL: https://datasheet.octopart.com:443/CRCW0402100KFKED-Vishay-datasheet-62316122.pdf?src-supplier=Future+Electronics; ComponentLink13Description: https://datasheet.octopart.com:443/CRCW0402100KFKED-Vishay-datasheet-62316122.pdf?src-supplier=Future+Electronics; ComponentLink14URL: https://datasheet.octopart.com:443/CRCW0402100KFKED-Vishay-datasheet-5306405.pdf?src-supplier=RS+(Formerly+Allied+Electronics); ComponentLink14Description: https://datasheet.octopart.com:443/CRCW0402100KFKED-Vishay-datasheet-5306405.pdf?src-supplier=RS+(Formerly+Allied+Electronics); ComponentLink15URL: https://datasheet.octopart.com:443/CRCW0402100KFKED-Vishay-Dale-datasheet-47688880.pdf?src-supplier=RS+(Formerly+Allied+Electronics); ComponentLink15Description: https://datasheet.octopart.com:443/CRCW0402100KFKED-Vishay-Dale-datasheet-47688880.pdf?src-supplier=RS+(Formerly+Allied+Electronics); ComponentLink16URL: https://datasheet.octopart.com:443/CRCW0402100KFKED-Vishay-datasheet-12001583.pdf?src-supplier=RS+(Formerly+Allied+Electronics); ComponentLink16Description: https://datasheet.octopart.com:443/CRCW0402100KFKED-Vishay-datasheet-12001583.pdf?src-supplier=RS+(Formerly+Allied+Electronics); ComponentLink17URL: https://datasheet.octopart.com:443/CRCW0402100KFKED-Vishay-datasheet-192322385.pdf?src-supplier=HQonline; ComponentLink17Description: https://datasheet.octopart.com:443/CRCW0402100KFKED-Vishay-datasheet-192322385.pdf?src-supplier=HQonline; ComponentLink18URL: https://datasheet.octopart.com:443/CRCW0402100KFKED-Vishay-datasheet-62332075.pdf?src-supplier=TME; ComponentLink18Description: https://datasheet.octopart.com:443/CRCW0402100KFKED-Vishay-datasheet-62332075.pdf?src-supplier=TME; ComponentLink19URL: https://datasheet.octopart.com/D-CRCW-e3-Standard-Thick-Film-Chip-Resistors-Vishay-datasheet-family-64.pdf; ComponentLink19Description: https://datasheet.octopart.com/D-CRCW-e3-Standard-Thick-Film-Chip-Resistors-Vishay-datasheet-family-64.pdf; ComponentLink20URL: https://datasheet.octopart.com:443/CRCW0402100KFKED-Vishay-datasheet-13242068.pdf?src-supplier=Farnell; ComponentLink20Description: https://datasheet.octopart.com:443/CRCW0402100KFKED-Vishay-datasheet-13242068.pdf?src-supplier=Farnell; ComponentLink21URL: https://datasheet.octopart.com:443/CRCW0402100KFKED-Vishay-datasheet-13195083.pdf?src-supplier=Farnell; ComponentLink21Description: https://datasheet.octopart.com:443/CRCW0402100KFKED-Vishay-datasheet-13195083.pdf?src-supplier=Farnell; ComponentLink22URL: https://datasheet.octopart.com:443/CRCW0402100KFKED-Vishay-datasheet-13034211.pdf?src-supplier=Farnell; ComponentLink22Description: https://datasheet.octopart.com:443/CRCW0402100KFKED-Vishay-datasheet-13034211.pdf?src-supplier=Farnell; ComponentLink23URL: https://datasheet.octopart.com:443/CRCW0402100KFKED-Vishay-datasheet-12600034.pdf?src-supplier=Farnell; ComponentLink23Description: https://datasheet.octopart.com:443/CRCW0402100KFKED-Vishay-datasheet-12600034.pdf?src-supplier=Farnell; ComponentLink24URL: https://datasheet.octopart.com:443/CRCW0402100KFKED-Vishay-datasheet-12532161.pdf?src-supplier=Farnell; ComponentLink24Description: https://datasheet.octopart.com:443/CRCW0402100KFKED-Vishay-datasheet-12532161.pdf?src-supplier=Farnell; ComponentLink25URL: https://datasheet.octopart.com:443/CRCW0402100KFKED-Vishay-datasheet-12517896.pdf?src-supplier=Farnell; ComponentLink25Description: https://datasheet.octopart.com:443/CRCW0402100KFKED-Vishay-datasheet-12517896.pdf?src-supplier=Farnell; ComponentLink26URL: https://datasheet.octopart.com:443/CRCW0402100KFKED-Vishay-datasheet-12509762.pdf?src-supplier=Farnell; ComponentLink26Description: https://datasheet.octopart.com:443/CRCW0402100KFKED-Vishay-datasheet-12509762.pdf?src-supplier=Farnell; ComponentLink27URL: https://datasheet.octopart.com:443/CRCW0402100KFKED-Vishay-datasheet-10322335.pdf?src-supplier=Farnell; ComponentLink27Description: https://datasheet.octopart.com:443/CRCW0402100KFKED-Vishay-datasheet-10322335.pdf?src-supplier=Farnell; ComponentLink28URL: https://datasheet.octopart.com:443/CRCW0402100KFKED-Vishay-datasheet-8788789.pdf?src-supplier=Farnell; ComponentLink28Description: https://datasheet.octopart.com:443/CRCW0402100KFKED-Vishay-datasheet-8788789.pdf?src-supplier=Farnell; ComponentLink29URL: https://datasheet.octopart.com:443/CRCW0402100KFKED-Vishay-datasheet-8361388.pdf?src-supplier=Farnell; ComponentLink29Description: https://datasheet.octopart.com:443/CRCW0402100KFKED-Vishay-datasheet-8361388.pdf?src-supplier=Farnell; ComponentLink30URL: https://datasheet.octopart.com:443/CRCW0402100KFKED-Vishay-datasheet-546287.pdf?src-supplier=Farnell; ComponentLink30Description: https://datasheet.octopart.com:443/CRCW0402100KFKED-Vishay-datasheet-546287.pdf?src-supplier=Farnell; ComponentLink31URL: https://datasheet.octopart.com:443/CRCW0402100KFKED-Vishay-datasheet-11540273.pdf?src-supplier=Arrow+Electronics; ComponentLink31Description: https://datasheet.octopart.com:443/CRCW0402100KFKED-Vishay-datasheet-11540273.pdf?src-supplier=Arrow+Electronics; ComponentLink32URL: https://datasheet.octopart.com:443/CRCW0402100KFKED-Vishay-datasheet-8619608.pdf?src-supplier=element14; ComponentLink32Description: https://datasheet.octopart.com:443/CRCW0402100KFKED-Vishay-datasheet-8619608.pdf?src-supplier=element14; ComponentLink33URL: https://datasheet.octopart.com:443/CRCW0402100KFKED-Vishay-datasheet-5377255.pdf?src-supplier=Garrett; ComponentLink33Description: https://datasheet.octopart.com:443/CRCW0402100KFKED-Vishay-datasheet-5377255.pdf?src-supplier=Garrett; ComponentLink34URL: https://datasheet.octopart.com:443/CRCW0402100KFKED-Vishay-datasheet-148188.pdf?src-supplier=Garrett; ComponentLink34Description: https://datasheet.octopart.com:443/CRCW0402100KFKED-Vishay-datasheet-148188.pdf?src-supplier=Garrett; ComponentLink35URL: https://datasheet.octopart.com:443/CRCW0402100KFKED-Vishay-datasheet-42367.pdf?src-supplier=Garrett; ComponentLink35Description: https://datasheet.octopart.com:443/CRCW0402100KFKED-Vishay-datasheet-42367.pdf?src-supplier=Garrett; ComponentLink36URL: http://sigma.octopart.com:80/rohs_certificate/D-CRCW-e3-Standard-Thick-Film-Chip-Resistors-Vishay-family-102.pdf?src-supplier=Compliance+Statements; ComponentLink36Description: http://sigma.octopart.com:80/rohs_certificate/D-CRCW-e3-Standard-Thick-Film-Chip-Resistors-Vishay-family-102.pdf?src-supplier=Compliance+Statements
U? = GeneratedSymbol: USB Type-C and BC1.2 5V 3.5A Output 36V Input Synchronous DC/DC Regulator 32-Pin VQFN; Manufacturer: Texas Instruments; Manufacturer Lifecycle Status: ACTIVE; Supplier: Arrow Electronics; Supplier Part Number: TPS25833QWRHBRQ1; Manufacturer Part Number: TPS25833QWRHBRQ1; RoHS: Compliant; Category: USB Interface ICs; Stock: 3000; Pricing: 3000=2.35 (USD); Case/Package: VQFN; Height: 1mm; Length: 5mm; Lifecycle Status: Production; Pins: 32; Schedule B: 8542390000|8542390000; Thickness: 900µm; Width: 5mm; ComponentLink1URL: https://octopart.com:443/opatz8j6/c1?t=QdtQ_5y6OoYO10vGMBHo0MkWWNg3WZcKByxVKRKibkrIArPmB0huZ0PTWgiVQyVM0r-KErAlqgl_GtZqS-zfbTH9MSEVf23tu6zsP7SwoH3cElgJzC1njavEoiPtv5zJyzI5TugnKjD-MwQN_tWNq7D4zs4hg9Jvnjhyur9u1VAzxy-x97OLvkn3T5o38e-A3hbTv1voPLaqbRoeq4uSWuj4oXJZ_6x5obgH2QuRMC6C-RM4You7UXlmIiUE0xXQlfjdTdGh5Mzji6m775kF51dkfg-oVXXT7eQkakUfxTXIZTGRZ9S2Te6OgLonkCf4Q48jzw2hIzpT3B6kxxuzoKhvga5DM2Eb2fh4XFQ3zjw1DN_Mg95a_8n3WVcIjlOyBCLqgiEN8_34Bg&src-supplier=Texas+Instruments; ComponentLink1Description: https://octopart.com:443/opatz8j6/c1?t=QdtQ_5y6OoYO10vGMBHo0MkWWNg3WZcKByxVKRKibkrIArPmB0huZ0PTWgiVQyVM0r-KErAlqgl_GtZqS-zfbTH9MSEVf23tu6zsP7SwoH3cElgJzC1njavEoiPtv5zJyzI5TugnKjD-MwQN_tWNq7D4zs4hg9Jvnjhyur9u1VAzxy-x97OLvkn3T5o38e-A3hbTv1voPLaqbRoeq4uSWuj4oXJZ_6x5obgH2QuRMC6C-RM4You7UXlmIiUE0xXQlfjdTdGh5Mzji6m775kF51dkfg-oVXXT7eQkakUfxTXIZTGRZ9S2Te6OgLonkCf4Q48jzw2hIzpT3B6kxxuzoKhvga5DM2Eb2fh4XFQ3zjw1DN_Mg95a_8n3WVcIjlOyBCLqgiEN8_34Bg&src-supplier=Texas+Instruments; ComponentLink2URL: https://datasheet.octopart.com:443/TPS25833QWRHBRQ1-Texas-Instruments-datasheet-165812046.pdf?src-supplier=SHENGYU+ELECTRONICS; ComponentLink2Description: https://datasheet.octopart.com:443/TPS25833QWRHBRQ1-Texas-Instruments-datasheet-165812046.pdf?src-supplier=SHENGYU+ELECTRONICS; ComponentLink3URL: http://sigma.octopart.com:80/reach_statement/Texas-Instruments-company-64.pdf?src-supplier=Compliance+Statements; ComponentLink3Description: http://sigma.octopart.com:80/reach_statement/Texas-Instruments-company-64.pdf?src-supplier=Compliance+Statements; ComponentLink4URL: http://sigma.octopart.com:80/conflict_mineral_statement/Texas-Instruments-company-63.pdf?src-supplier=Compliance+Statements; ComponentLink4Description: http://sigma.octopart.com:80/conflict_mineral_statement/Texas-Instruments-company-63.pdf?src-supplier=Compliance+Statements